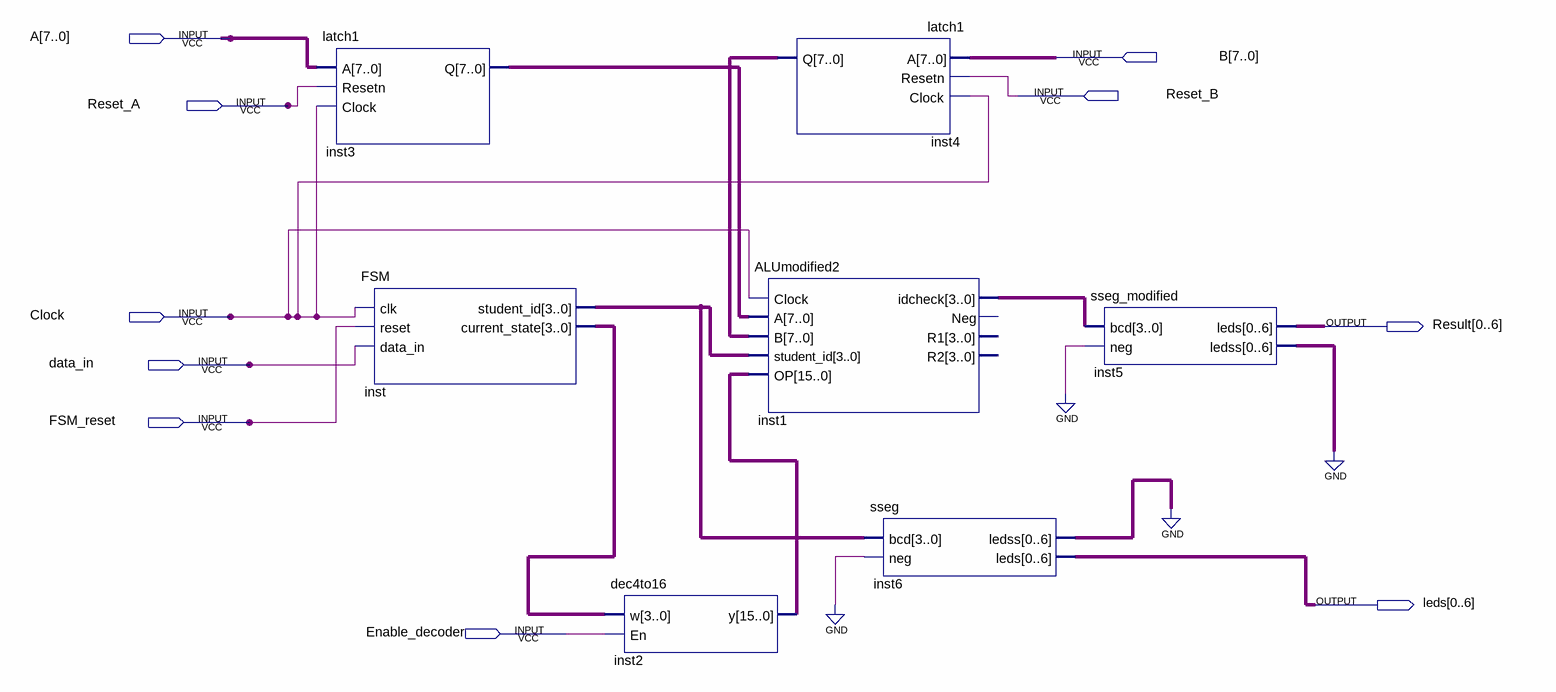
[diagram p0: schematic sheet]
// Quartus schematic Block2.bdf as structural Verilog: 7 symbols, 10 pins
module Block2 (
  input  [7:0] A,
  input  [7:0] B,
  input  Reset_B,
  input  Reset_A,
  input  Clock,
  input  data_in,
  input  FSM_reset,
  input  Enable_decoder,
  output [0:6] Result,
  output [0:6] leds
);

  wire [3:0] inst1_idcheck, inst_current_state, inst_student_id;
  wire [6:0] inst5_ledss, inst6_ledss;
  wire [7:0] inst3_q, inst4_q;
  wire [15:0] inst2_y;

  latch1 inst3 (.A(A), .Resetn(Reset_A), .Clock(Clock), .Q(inst3_q));
  FSM inst (
    .clk(Clock), .reset(FSM_reset), .data_in(data_in), .student_id(inst_student_id),
    .current_state(inst_current_state));
  dec4to16 inst2 (.w(inst_current_state), .En(Enable_decoder), .y(inst2_y));
  latch1 inst4 (.A(B), .Resetn(Reset_B), .Clock(Clock), .Q(inst4_q));
  ALUmodified2 inst1 (
    .Clock(Clock), .A(inst3_q), .B(inst4_q), .student_id(inst_student_id), .OP(inst2_y),
    .idcheck(inst1_idcheck));  // open: Neg, R1, R2
  sseg inst6 (.bcd(inst_student_id), .neg(1'b0), .ledss(inst6_ledss), .leds(leds));
  sseg_modified inst5 (.bcd(inst1_idcheck), .neg(1'b0), .leds(Result), .ledss(inst5_ledss));
  // also tied to GND on the sheet: {inst6_ledss[0], inst6_ledss[1], inst6_ledss[2], inst6_ledss[3], inst6_ledss[4], inst6_ledss[5], inst6_ledss[6], inst5_ledss[0], inst5_ledss[1], inst5_ledss[2], inst5_ledss[3], inst5_ledss[4], inst5_ledss[5], inst5_ledss[6]}
endmodule
